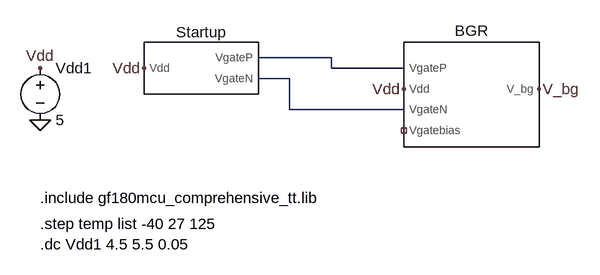
[diagram p0: schematic BGR_Startup_check.asc]
BGR_Startup_check.asc, the LTspice schematic file:
Version 4.1
SHEET 1 1000 700
WIRE 96 -16 208 -16
WIRE 208 -16 208 0
WIRE 208 0 320 0
WIRE 96 16 144 16
WIRE 144 16 144 64
WIRE 144 64 320 64
FLAG -80 0 Vdd
FLAG 320 32 Vdd
FLAG 528 32 V_bg
FLAG -240 0 Vdd
FLAG -240 80 0
SYMBOL Startup 0 0 R0
SYMATTR InstName Startup
SYMBOL BGR 400 0 R0
SYMATTR InstName BGR
SYMBOL voltage -240 -16 R0
WINDOW 123 0 0 Left 0
WINDOW 39 0 0 Left 0
SYMATTR InstName Vdd1
SYMATTR Value 5
TEXT -240 200 Left 2 !.include gf180mcu_comprehensive_tt.lib
TEXT -240 240 Left 2 !.step temp list -40 27 125\n.dc Vdd1 4.5 5.5 0.05

The netlist it stands for:
* BGR_Startup_check.asc
X§Startup Vdd N002 N001 Startup  ; pins Vdd VgateN VgateP
X§BGR Vdd V_bg N001 N002 NC_01 BGR  ; pins Vdd V_bg VgateP VgateN Vgatebias
Vdd1 Vdd 0 5
.include gf180mcu_comprehensive_tt.lib
.step temp list -40 27 125
.dc Vdd1 4.5 5.5 0.05
.backanno
.end